# Altium schematic sheet MAGDECK.SchDoc
size A3; SheetNumber: 1; SheetTotal: 1
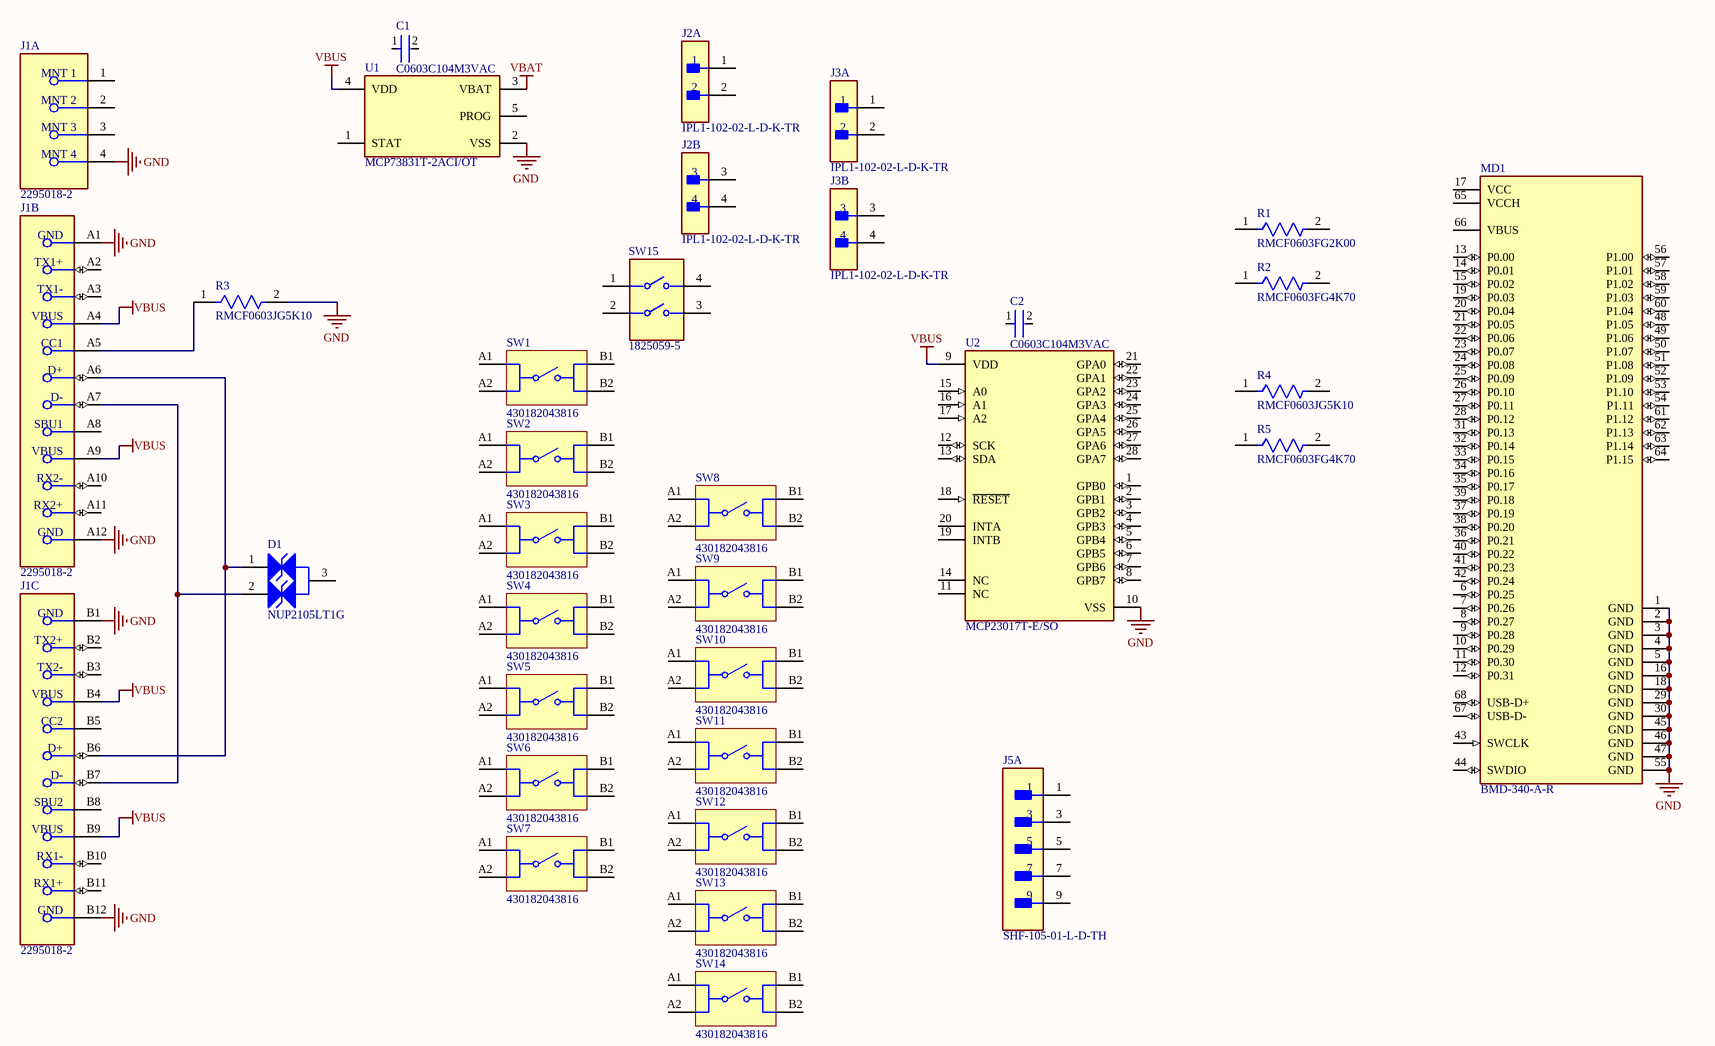
[diagram p0: MAGDECK.SchDoc]

## Parts
C1  C0603C104M3VAC  [FP-C0603C-CF-MFG]
C2  C0603C104M3VAC  [FP-C0603C-CF-MFG]
D1  NUP2105LT1G  [ONSC-SOT-23-3-318-08_V]
J1  2295018-2  [FP-2295018-2-MFG]  (parts A,B,C of 3)
J2  IPL1-102-02-L-D-K-TR  [FP-IPL1-102-02-L-D-K-TR-0]  (parts A,B of 2)
J3  IPL1-102-02-L-D-K-TR  [FP-IPL1-102-02-L-D-K-TR-0]  (parts A,B of 2)
J5  SHF-105-01-L-D-TH  [FP-SHF-105-01-L-D-TH-MFG]  (part A of 2)
MD1  BMD-340-A-R  [FP-BMD-340-A-R-MFG]
R1  RMCF0603FG2K00  [FP-RMCF0603-IPC_C]
R2  RMCF0603FG4K70  [FP-RMCF0603-IPC_B]
R3  RMCF0603JG5K10  [FP-RMCF0603-IPC_A]
R4  RMCF0603JG5K10  [FP-RMCF0603-IPC_A]
R5  RMCF0603FG4K70  [FP-RMCF0603-IPC_B]
SW1  430182043816  [430182043816]
SW2  430182043816  [430182043816]
SW3  430182043816  [430182043816]
SW4  430182043816  [430182043816]
SW5  430182043816  [430182043816]
SW6  430182043816  [430182043816]
SW7  430182043816  [430182043816]
SW8  430182043816  [430182043816]
SW9  430182043816  [430182043816]
SW10  430182043816  [430182043816]
SW11  430182043816  [430182043816]
SW12  430182043816  [430182043816]
SW13  430182043816  [430182043816]
SW14  430182043816  [430182043816]
SW15  1825059-5  [FP-1825059-5-MFG]
U1  MCP73831T-2ACI/OT  [FP-C04-091-OT-IPC_B]
U2  MCP23017T-E/SO  [FP-C04-052-MFG]

## Nets
GND: J1.4(MNT_4) J1.A1(GND) J1.A12(GND) J1.B1(GND) J1.B12(GND) MD1.1(GND) MD1.2(GND) MD1.3(GND) MD1.4(GND) MD1.5(GND) MD1.16(GND) MD1.18(GND) MD1.29(GND) MD1.30(GND) MD1.45(GND) MD1.46(GND) MD1.47(GND) MD1.55(GND) R3.2 U1.2(VSS) U2.10(VSS)
VBAT: U1.3(VBAT)
VBUS: J1.A4(VBUS) J1.A9(VBUS) J1.B4(VBUS) J1.B9(VBUS) U1.4(VDD) U2.9(VDD)
NetD1_1: D1.1(K) J1.A6(D+) J1.B6(D+)
NetD1_2: D1.2(K) J1.A7(D-) J1.B7(D-)
NetJ1_A5: J1.A5(CC1) R3.1

Not connected (* = marked no-connect by the designer): C1 1 2; C2 1 2; D1 3(K); J1 1(MNT_1) 2(MNT_2) 3(MNT_3) A2(TX1+) A3(TX1-) A8(SBU1) A10(RX2-) A11(RX2+) B2(TX2+) B3(TX2-) B5(CC2) B8(SBU2) B10(RX1-) B11(RX1+); J2 1 2 3 4; J3 1 2 3 4; J5 1 3 5 7 9; MD1 6(P0.25) 7(P0.26) 8(P0.27) 9(P0.28) 10(P0.29) 11(P0.30) 12(P0.31) 13(P0.00) 14(P0.01) 15(P0.02) 17(VCC) 19(P0.03) 20(P0.04) 21(P0.05) 22(P0.06) 23(P0.07) 24(P0.08) 25(P0.09) 26(P0.10) 27(P0.11) 28(P0.12) 31(P0.13) 32(P0.14) 33(P0.15) 34(P0.16) 35(P0.17) 36(P0.21) 37(P0.19) 38(P0.20) 39(P0.18) 40(P0.22) 41(P0.23) 42(P0.24) 43(SWCLK) 44(SWDIO) 48(P1.05) 49(P1.06) 50(P1.07) 51(P1.08) 52(P1.09) 53(P1.10) 54(P1.11) 56(P1.00) 57(P1.01) 58(P1.02) 59(P1.03) 60(P1.04) 61(P1.12) 62(P1.13) 63(P1.14) 64(P1.15) 65(VCCH) 66(VBUS) 67(USB-D-) 68(USB-D+); R1 1 2; R2 1 2; R4 1 2; R5 1 2; SW1 A1 A2 B1 B2; SW2 A1 A2 B1 B2; SW3 A1 A2 B1 B2; SW4 A1 A2 B1 B2; SW5 A1 A2 B1 B2; SW6 A1 A2 B1 B2; SW7 A1 A2 B1 B2; SW8 A1 A2 B1 B2; SW9 A1 A2 B1 B2; SW10 A1 A2 B1 B2; SW11 A1 A2 B1 B2; SW12 A1 A2 B1 B2; SW13 A1 A2 B1 B2; SW14 A1 A2 B1 B2; SW15 1 2 3 4; U1 1(STAT) 5(PROG); U2 1(GPB0) 2(GPB1) 3(GPB2) 4(GPB3) 5(GPB4) 6(GPB5) 7(GPB6) 8(GPB7) 11(NC) 12(SCK) 13(SDA) 14(NC) 15(A0) 16(A1) 17(A2) 18(~{RESET}) 19(INTB) 20(INTA) 21(GPA0) 22(GPA1) 23(GPA2) 24(GPA3) 25(GPA4) 26(GPA5) 27(GPA6) 28(GPA7)

## Library data of the parts
C1 C2 = CMP-03020-028681-2: C0603 0.10 μF Y5V 30ppm/°C 20.00% 25 V; Manufacturer: KEMET; Value: 0.10 μF; Voltage Rating: 25 V; Automotive Grade: Grade 1; Material: Ceramic; Tolerance: 0.2; Package: C0603C-CF; Category: Cap; Device Class L2: Capacitors; ComponentLink2Description: Datasheet; Temperature: -55°C to +125°C; Device Class L3: Ceramic Capacitors; Octopart: https://octopart.com/c0603c104m3vac-kemet-1325404; Height: 0.87mm; Mouser Description: Cap .10UF 25V Ceramic Y5V 0603; Manufacturer Part Number: C0603C104M3VAC; Capacitance: 0.10 μF; Lead Free: Yes; Temperature Characteristic: Y5V; Temperature Range Low: -55°C; Temperature Coefficient: 30ppm/°C; Temperature Range High: +125°C; Device Class L1: Passive Components; Automotive: Yes; ComponentLink2URL: https://api.kemet.com/component-edge/download/datasheet/C0603C100J5GACAUTO.pdf; RoHS: TRUE
D1 = CMP-1063-00164-1: Dual Line CAN Bus Protector, 3-Pin SOT-23, Pb-Free, Tape and Reel; Manufacturer: On Semiconductor; IR Max (uA): 0.1; Number of Lines: 2; Direction: Bidirectional; C Max (pF): 30; PPK Max (W): 350; V(BR) Min (V): 26.2; ComponentLink3URL: http://www.onsemi.cn/pub_link/Collateral/318-08.PDF; Mounting Technology: Surface Mount; ComponentLink2Description: Datasheet; PartNumber: NUP2105LT1G; ComponentLink1URL: http://www.onsemi.com/; PackageVersion: Rev. AP, 11/2009; DatasheetVersion: Rev. 5; RoHS: Pb-Free; PackageReference: SOT-23-3-318-08; ComponentLink2URL: http://www.onsemi.cn/pub_link/Collateral/NUP2105L-D.PDF; ComponentLink1Description: Manufacturer URL; PackageDescription: 3-Pin Small Outline Transistor, Body 2.92 x 1.3 mm, Pitch 0.95 mm; Packing: Tape and Reel; ComponentLink3Description: Package Specification
J1 = CMP-03360-000011-1: CONN RCPT USB3.1 TYPEC 24POS SMD; Plating: Bright; Contact Current Rating: 5A; Connector System: Cable-to-Board; Number of Ports: 1; Circuit Application: Signal; Number of Positions: 24; Gender: Receptacle; Pitch: 0.5mm; Lead Free: Lead Free; Packaging: Tape and Reel; Min Operating Temperature: -30°C; RoHS Compliant: Yes; Housing Color: Black; Housing Material: Thermoplastic; Orientation: Right Angle; Connector Type: Receptacle; Max Operating Temperature: 85°C; USB Standard: USB 3.1; Contact Material: Copper Alloy; Contact Plating: Gold; Termination: SMD/SMT
J2 J3 = CMP-02766-000778-1: 2 Position 2 Row .100" (2.54 mm) pitch connector; Gender: Male; Pitch: 2.54mm; Orientation: Straight; Mount: Surface Mount; Number of Pins: 4; Termination: Solder
J5 = CMP-02766-000059-1: CONN HEADER VERT 10POS 1.27MM; Manufacturer: Samtec; Standoff Height: 0.38mm; Conn Orientation: Vertical; Conn Gender: Male; Number Of Contacts: 10; Device Class L3: unset; Temperature Range Low: -55°C; Manufacturer Part Number: SHF-105-01-L-D-TH; Pitch: 1.27mm; RoHS: TRUE; Digikey Description: CONN HEADER VERT 10POS 1.27MM; ComponentLink2Description: Datasheet; Temperature: -55°C to +125°C; Lead Free: Yes; Device Class L1: Connectors; Height: 5.46mm; Category: Conn; Mouser Description: Conn Shrouded Header (4 Sides) HDR 10 POS 1.27mm Solder ST Thru-Hole Tube; Footprint Url: http://suddendocs.samtec.com/prints/shf-1xx-01-x-d-xx-xx-footprint.pdf; Number Of Rows: 2; Device Class L2: Headers and Wire Housings; Temperature Range High: +125°C; ComponentLink2URL: http://suddendocs.samtec.com/prints/shf-1xx-01-x-d-xx-xx-mkt.pdf; Automotive: No; Octopart: https://octopart.com/shf-105-01-l-d-th-samtec-17904677; Package: 0; Contact Material: Gold,Nickel
MD1 = CMP-207130-000025-1: RX TXRX MOD BT 5.0 TRC ANT SMD; RoHS Compliant: Yes
R1 = CMP-26527-003372-1: 2kΩ ±1% 0.1W 0603 Thick Film Chip Resistor AEC-Q200 compliant; Resistance: 2kR; Temperature Coefficient: 100ppm/°C; Resistor Type: Thick Film; Contact Plating: Tin; Radiation Hardening: No; Case/Package: 0603; Max Operating Temperature: 155°C; RoHS Compliant: Yes; Packaging: Tape and Reel; Mount: Surface Mount; Min Operating Temperature: -55°C; Tolerance: 1%
R2 R5 = CMP-26527-004068-1: 4.7kΩ ±1% 0.1W 0603 Thick Film Chip Resistor AEC-Q200 compliant; Resistance: 4.7kR; Temperature Coefficient: 100ppm/°C; Max Power Dissipation: 100mW; Length: 0.061inch; Tolerance: 1%; Series: RMCF; Resistor Type: Thick Film; Packaging: Tape and Reel; Features: Automotive AEC-Q200; Max Operating Temperature: 155°C; Number of Terminations: 2; RoHS Compliant: Yes; Case/Package: 0603; Width: 0.031inch; Height: 0.022inch; Min Operating Temperature: -55°C; Mount: Surface Mount
R3 R4 = CMP-26527-001717-1: 5.1kΩ ±5% 0.1W 0603 Thick Film Chip Resistor AEC-Q200 compliant; Resistance: 5.1kR; Max Power Dissipation: 100mW; Temperature Coefficient: 200ppm/°C; Height: 0.022inch; Number of Terminations: 2; Features: Automotive AEC-Q200; Resistor Type: Thick Film; Length: 0.061inch; Min Operating Temperature: -55°C; Packaging: Tape and Reel; Max Operating Temperature: 155°C; Tolerance: 5%; Package Quantity: 1; Series: RMCF; Contact Plating: Tin; Width: 0.031inch; Mount: Surface Mount; RoHS Compliant: Yes; Case/Package: 0603; Case Code (Metric): 1608; Case Code (Imperial): 0603; Radiation Hardening: No
SW1-SW14 = CMP-1452-00013-6: Switch Tactile Spst-no 0.05A 12V; Manufacturer Lifecycle Status: ACTIVE; Contact Current Rating: 50mA; Throw Configuration: SPST; Actuator Length: 900µm; Illumination Type: Illuminated, Non-Illuminated; Mechanical Life: 1Mcycles; Insulation Resistance: 100MΩ; Switch Travel: 250µm; YEOL: 1 = Estimated lifetime > 10 years; Actuator Material: Liquid Crystal Polymer, Polymer; Switch Function: Off-Mom; Height: 4.3mm; Color: Black; Current Rating: 50mA; Lead Free: Lead Free; Packaging: Tape and Reel; RoHS: Compliant; Width: 6.2mm; Termination: Gull Wing; REACH SVHC: No; Contact Plating: Silver; Lifecycle Status: Production; Voltage Rating: 12V; Diameter: 3.5mm; Min Operating Temperature: -40°C; Length: 6.2mm; Max Operating Temperature: 85°C; Mount: Surface Mount; Contact Resistance: 100mΩ; Contact Material: Stainless Steel, Steel
SW15 = CMP-03400-000020-1: SWITCH SLIDE DIP SPST 100MA 24V; Number of Circuits: 2; Contact Current Rating: 1A; Actuator Type: Standard; Washable: Yes; Sealable: Yes (With); Pitch: 0.1inch; Voltage Rating (DC): 5V; RoHS Compliant: Yes; Max Voltage Rating (DC): 24V; Max Current Rating: 100mA; Throw Configuration: SPST; Housing Color: Black; Type: Switch; ELV: Compliant; Flammability Rating: UL94 V-0; Max Operating Temperature: 85°C; Termination: Gull Wing; Mount: Surface Mount; Contact Material: Copper Alloy; Length: 7.06mm; Radiation Hardening: No; Packaging: Rail/Tube; Lead Free: Lead Free; Package Quantity: 60; Min Operating Temperature: -30°C; Contact Plating: Gold; Height: 0.138inch; Housing Material: Polyphenylene; Series: ADF, Alcoswitch; Orientation: Straight; Number of Positions: 2
U1 = CMP-0133-00143-2: IC CONTROLLR LI-ION 4.2V SOT23-5; Max Power Dissipation: 1.54W; Output Current: 500mA; Max Output Voltage: 4.5V; Number of Outputs: 1; Min Output Voltage: 4.168V; Min Supply Voltage: 3.75V; Max Input Voltage: 6V; Voltage Rating: 4.534V; Drain to Source Resistance: 350mR; Max Operating Temperature: 85°C; Length: 0.122inch; Number of Pins: 5; REACH SVHC: No SVHC; Radiation Hardening: No; Min Operating Temperature: -40°C; Weight: 0.00709oz; Contact Plating: Tin; Termination: SMD/SMT; Case/Package: SOT-23; Mount: Surface Mount; Width: 0.071inch; Packaging: Tape and Reel; Number of Cells: 1; Max Charge Current: 500mA; Height: 0.051inch; Number of Channels: 1; Output Voltage: 4.2V; Max Supply Voltage: 6V; Lead Free: Lead Free
U2 = CMP-0186-00060-3: IC I/O EXPANDER I2C 16B 28SOIC; Number of Channels: 1; Operating Supply Voltage: 5.5V; Max Frequency: 1.7MHz; Nominal Supply Current: 1mA; Number of Bits: 16; Interface: I2C; Number of Pins: 28; Max Operating Temperature: 125°C; Packaging: Tape and Reel; Case/Package: SOIC; Package Quantity: 1600; Min Operating Temperature: -40°C; Lead Free: Lead Free; Frequency: 1.7MHz; Number of I/Os: 16